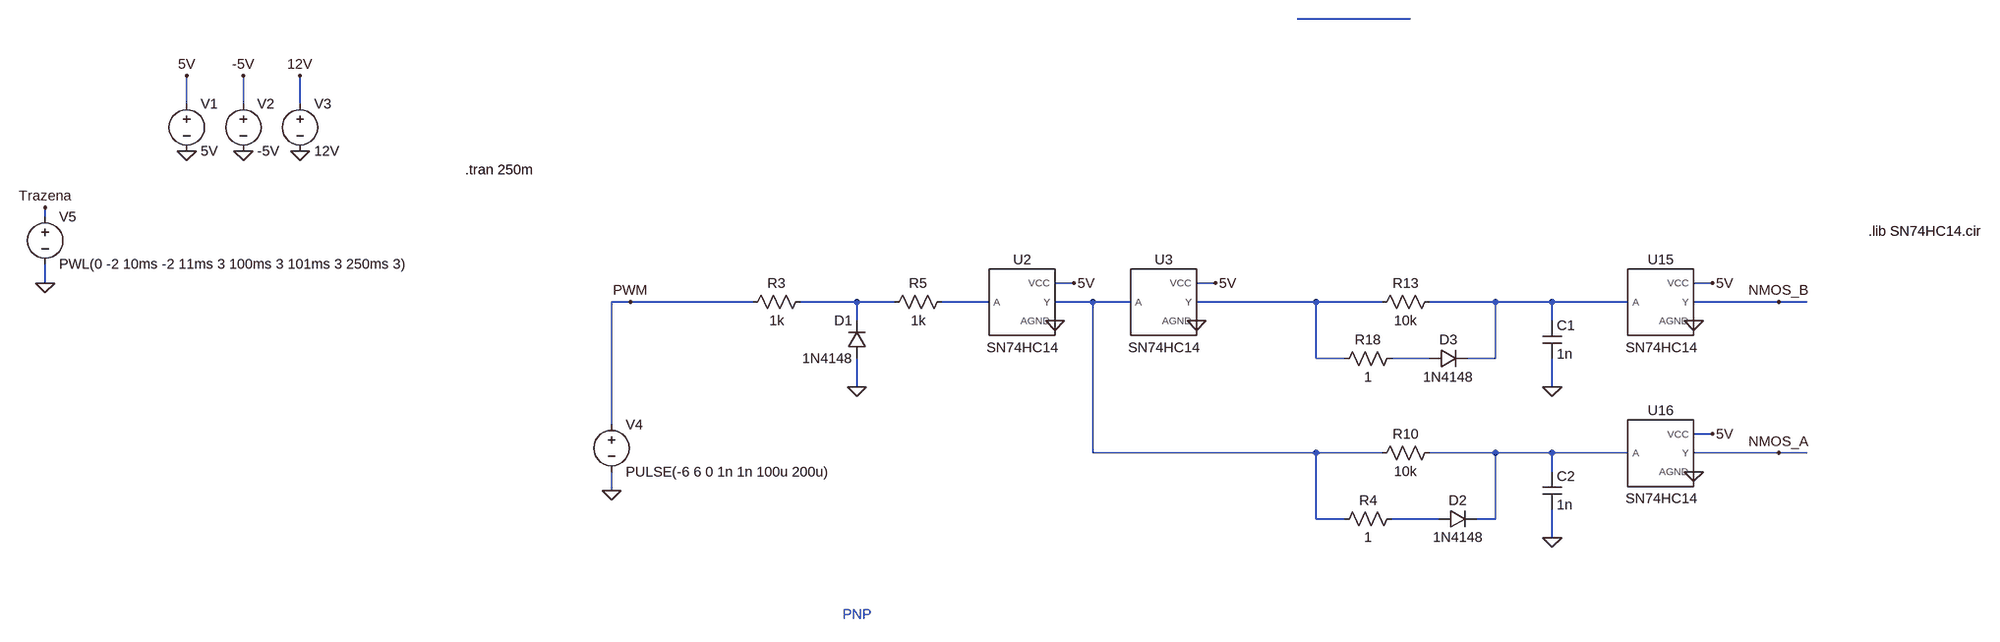
[diagram p0: schematic gate_drivers_3.asc]
gate_drivers_3.asc, the LTspice schematic file:
Version 4
SHEET 1 6380 2180
WIRE 2128 -960 1936 -960
WIRE -1152 -816 -1152 -864
WIRE -1056 -816 -1056 -864
WIRE -960 -816 -960 -864
WIRE -1392 -624 -1392 -640
WIRE -1392 -512 -1392 -544
WIRE 1424 -512 1392 -512
WIRE 1664 -512 1632 -512
WIRE 2640 -512 2608 -512
WIRE 672 -480 640 -480
WIRE 880 -480 672 -480
WIRE 1056 -480 960 -480
WIRE 1120 -480 1056 -480
WIRE 1280 -480 1200 -480
WIRE 1456 -480 1392 -480
WIRE 1520 -480 1456 -480
WIRE 1968 -480 1632 -480
WIRE 2080 -480 1968 -480
WIRE 2272 -480 2160 -480
WIRE 2368 -480 2272 -480
WIRE 2496 -480 2368 -480
WIRE 2752 -480 2608 -480
WIRE 2800 -480 2752 -480
WIRE 1056 -448 1056 -480
WIRE 2368 -448 2368 -480
WIRE 1968 -384 1968 -480
WIRE 2016 -384 1968 -384
WIRE 2160 -384 2096 -384
WIRE 2272 -384 2272 -480
WIRE 2272 -384 2224 -384
WIRE 1056 -336 1056 -384
WIRE 2368 -336 2368 -384
WIRE 640 -272 640 -480
WIRE 2640 -256 2608 -256
WIRE 1456 -224 1456 -480
WIRE 1968 -224 1456 -224
WIRE 2080 -224 1968 -224
WIRE 2272 -224 2160 -224
WIRE 2368 -224 2272 -224
WIRE 2496 -224 2368 -224
WIRE 2752 -224 2608 -224
WIRE 2800 -224 2752 -224
WIRE 2368 -192 2368 -224
WIRE 640 -160 640 -192
WIRE 1968 -112 1968 -224
WIRE 2016 -112 1968 -112
WIRE 2176 -112 2096 -112
WIRE 2272 -112 2272 -224
WIRE 2272 -112 2240 -112
WIRE 2368 -80 2368 -128
FLAG -1152 -736 0
FLAG -1152 -864 5V
FLAG -1056 -736 0
FLAG -1056 -864 -5V
FLAG -960 -736 0
FLAG -960 -864 12V
FLAG 672 -480 PWM
FLAG -1392 -512 0
FLAG -1392 -640 Trazena
FLAG 2640 -512 5V
FLAG 2608 -448 0
FLAG 2640 -256 5V
FLAG 2608 -192 0
FLAG 640 -160 0
FLAG 2368 -336 0
FLAG 2368 -80 0
FLAG 2752 -224 NMOS_A
FLAG 2752 -480 NMOS_B
FLAG 1424 -512 5V
FLAG 1392 -448 0
FLAG 1664 -512 5V
FLAG 1632 -448 0
FLAG 1056 -336 0
SYMBOL voltage -1152 -832 R0
WINDOW 123 0 0 Left 0
WINDOW 39 0 0 Left 0
SYMATTR InstName V1
SYMATTR Value 5V
SYMBOL voltage -1056 -832 R0
WINDOW 123 0 0 Left 0
WINDOW 39 0 0 Left 0
SYMATTR InstName V2
SYMATTR Value -5V
SYMBOL voltage -960 -832 R0
WINDOW 123 0 0 Left 0
WINDOW 39 0 0 Left 0
SYMATTR InstName V3
SYMATTR Value 12V
SYMBOL res 2176 -240 R90
WINDOW 0 0 56 VBottom 2
WINDOW 3 32 56 VTop 2
SYMATTR InstName R10
SYMATTR Value 10k
SYMBOL voltage -1392 -640 R0
WINDOW 123 0 0 Left 0
WINDOW 39 0 0 Left 0
SYMATTR InstName V5
SYMATTR Value PWL(0 -2 10ms -2 11ms 3 100ms 3 101ms 3 250ms 3)
SYMBOL diode 2176 -96 R270
WINDOW 0 32 32 VTop 2
WINDOW 3 0 32 VBottom 2
SYMATTR InstName D2
SYMATTR Value 1N4148
SYMBOL res 2112 -128 R90
WINDOW 0 0 56 VBottom 2
WINDOW 3 32 56 VTop 2
SYMATTR InstName R4
SYMATTR Value 1
SYMBOL res 2176 -496 R90
WINDOW 0 0 56 VBottom 2
WINDOW 3 32 56 VTop 2
SYMATTR InstName R13
SYMATTR Value 10k
SYMBOL diode 2160 -368 R270
WINDOW 0 32 32 VTop 2
WINDOW 3 0 32 VBottom 2
SYMATTR InstName D3
SYMATTR Value 1N4148
SYMBOL res 2112 -400 R90
WINDOW 0 0 56 VBottom 2
WINDOW 3 32 56 VTop 2
SYMATTR InstName R18
SYMATTR Value 1
SYMBOL SN74HC14 2544 -496 R0
WINDOW 3 9 78 Top 2
SYMATTR InstName U15
SYMBOL SN74HC14 2544 -240 R0
WINDOW 3 9 78 Top 2
SYMATTR InstName U16
SYMBOL voltage 640 -288 R0
WINDOW 123 0 0 Left 0
WINDOW 39 0 0 Left 0
SYMATTR InstName V4
SYMATTR Value PULSE(-6 6 0 1n 1n 100u 200u)
SYMBOL cap 2352 -448 R0
SYMATTR InstName C1
SYMATTR Value 1n
SYMBOL cap 2352 -192 R0
SYMATTR InstName C2
SYMATTR Value 1n
SYMBOL SN74HC14 1328 -496 R0
WINDOW 3 9 78 Top 2
SYMATTR InstName U2
SYMBOL SN74HC14 1568 -496 R0
WINDOW 3 9 78 Top 2
SYMATTR InstName U3
SYMBOL res 976 -496 R90
WINDOW 0 0 56 VBottom 2
WINDOW 3 32 56 VTop 2
SYMATTR InstName R3
SYMATTR Value 1k
SYMBOL diode 1072 -384 R180
WINDOW 0 24 64 Left 2
WINDOW 3 24 0 Left 2
SYMATTR InstName D1
SYMATTR Value 1N4148
SYMBOL res 1216 -496 R90
WINDOW 0 0 56 VBottom 2
WINDOW 3 32 56 VTop 2
SYMATTR InstName R5
SYMATTR Value 1k
TEXT -680 -704 Left 2 !.tran 250m
TEXT 1032 688 Left 2 ;PNP
TEXT 3368 -600 Left 2 !.lib SN74HC14.cir

The netlist it stands for:
* gate_drivers_3.asc
V1 5V 0 5V
V2 -5V 0 -5V
V3 12V 0 12V
R10 N008 N004 10k
V5 Trazena 0 PWL(0 -2 10ms -2 11ms 3 100ms 3 101ms 3 250ms 3)
D2 N009 N008 1N4148
R4 N009 N004 1
R13 N006 N005 10k
D3 N007 N006 1N4148
R18 N007 N005 1
XU15 NMOS_B N006 5V 0 SN74HC14  ; pins Y A VCC AGND
XU16 NMOS_A N008 5V 0 SN74HC14  ; pins Y A VCC AGND
V4 PWM 0 PULSE(-6 6 0 1n 1n 100u 200u)
C1 N006 0 1n
C2 N008 0 1n
XU2 N004 N003 5V 0 SN74HC14  ; pins Y A VCC AGND
XU3 N005 N004 5V 0 SN74HC14  ; pins Y A VCC AGND
R3 N002 PWM 1k
D1 0 N002 1N4148
R5 N003 N002 1k
.model D D
.lib standard.dio
.tran 250m
* PNP
.lib SN74HC14.cir
.lib SN74HC14.cir
.backanno
.end